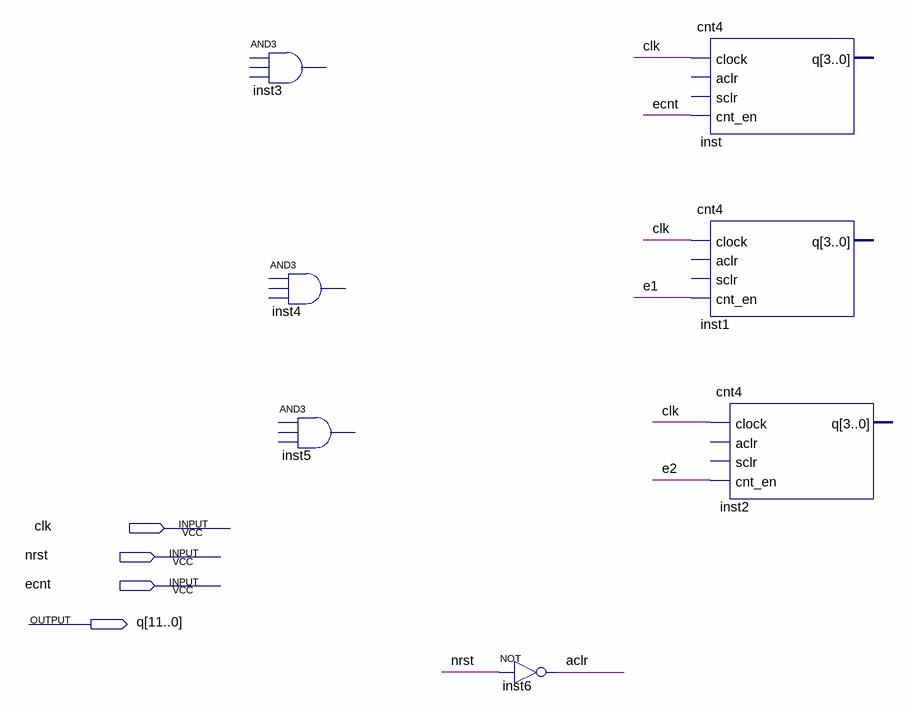
[diagram p0: schematic sheet]
// Quartus schematic BCDcnt3.bdf as structural Verilog: 7 symbols, 4 pins
module BCDcnt3 (
  input  clk,
  input  nrst,
  input  ecnt,
  output [11:0] q
);

  wire aclr, e1, e2;

  // AND3 inst3 is placed but not wired
  // AND3 inst4 is placed but not wired
  // AND3 inst5 is placed but not wired
  not inst6 (aclr, nrst);
  cnt4 inst (.clock(clk), .cnt_en(ecnt));  // open: aclr, sclr, q
  cnt4 inst1 (.clock(clk), .cnt_en(e1));  // open: aclr, sclr, q
  cnt4 inst2 (.clock(clk), .cnt_en(e2));  // open: aclr, sclr, q
endmodule
